# Altium schematic sheet MCU_CORE.SchDoc
size A4; SheetNumber: 4; SheetTotal: 9
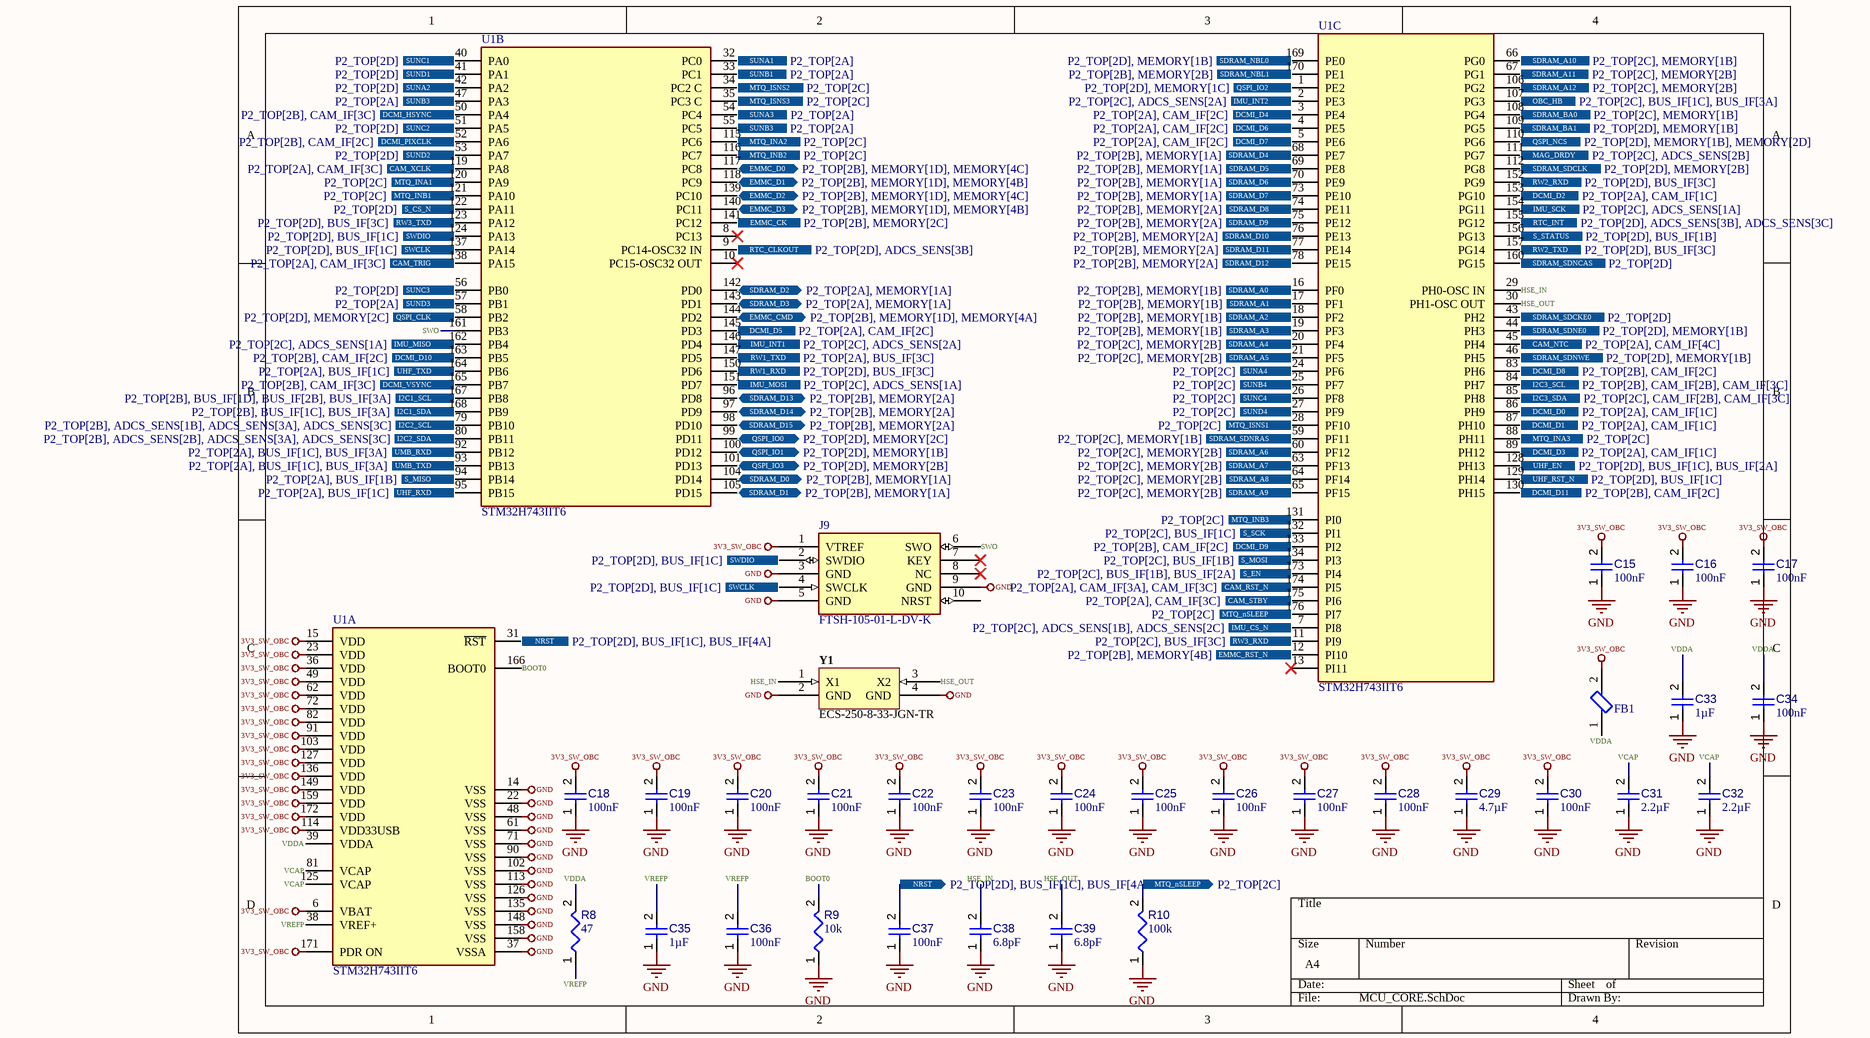
[diagram p0: MCU_CORE.SchDoc]

## Parts
C15  value 100nF  [CAPC0402(1005)60_L]  (hidden comment: Capacitor 100nF +/-20% 25V 0402)
C16  value 100nF  [CAPC0402(1005)60_L]  (hidden comment: Capacitor 100nF +/-20% 25V 0402)
C17  value 100nF  [CAPC0402(1005)60_L]  (hidden comment: Capacitor 100nF +/-20% 25V 0402)
C18  value 100nF  [CAPC0402(1005)60_L]  (hidden comment: Capacitor 100nF +/-20% 25V 0402)
C19  value 100nF  [CAPC0402(1005)60_L]  (hidden comment: Capacitor 100nF +/-20% 25V 0402)
C20  value 100nF  [CAPC0402(1005)60_L]  (hidden comment: Capacitor 100nF +/-20% 25V 0402)
C21  value 100nF  [CAPC0402(1005)60_L]  (hidden comment: Capacitor 100nF +/-20% 25V 0402)
C22  value 100nF  [CAPC0402(1005)60_L]  (hidden comment: Capacitor 100nF +/-20% 25V 0402)
C23  value 100nF  [CAPC0402(1005)60_L]  (hidden comment: Capacitor 100nF +/-20% 25V 0402)
C24  value 100nF  [CAPC0402(1005)60_L]  (hidden comment: Capacitor 100nF +/-20% 25V 0402)
C25  value 100nF  [CAPC0402(1005)60_L]  (hidden comment: Capacitor 100nF +/-20% 25V 0402)
C26  value 100nF  [CAPC0402(1005)60_L]  (hidden comment: Capacitor 100nF +/-20% 25V 0402)
C27  value 100nF  [CAPC0402(1005)60_L]  (hidden comment: Capacitor 100nF +/-20% 25V 0402)
C28  value 100nF  [CAPC0402(1005)60_L]  (hidden comment: Capacitor 100nF +/-20% 25V 0402)
C29  value 4.7µF  [CAPC0805(2012)145_L]  (hidden comment: Capacitor 4.7µF +/-40% 25V 0805)
C30  value 100nF  [CAPC0402(1005)60_L]  (hidden comment: Capacitor 100nF +/-20% 10V 0402)
C31  value 2.2µF  [CAPC0603(1608)100_L]  (hidden comment: Capacitor 4.7µF +/-20% 10V 0603)
C32  value 2.2µF  [CAPC0603(1608)100_L]  (hidden comment: Capacitor 4.7µF +/-20% 10V 0603)
C33  value 1µF  [CAPC0603(1608)100_L]  (hidden comment: Capacitor 1µF +/-0.1% 25V 0603)
C34  value 100nF  [CAPC0402(1005)60_L]  (hidden comment: Capacitor 100nF +/-20% 10V 0402)
C35  value 1µF  [CAPC0603(1608)100_L]  (hidden comment: Capacitor 1µF +/-0.1% 25V 0603)
C36  value 100nF  [CAPC0402(1005)60_L]  (hidden comment: Capacitor 100nF +/-20% 10V 0402)
C37  value 100nF  [CAPC0402(1005)60_L]  (hidden comment: Capacitor 100nF +/-20% 10V 0402)
C38  value 6.8pF  [CAPC1005X56X25NL10T15]  (hidden comment: Capacitor 6.8 nF +/- 10% 16 V 0402)
C39  value 6.8pF  [CAPC1005X56X25NL10T15]  (hidden comment: Capacitor 6.8 nF +/- 10% 16 V 0402)
FB1  BLM15AG601SN1D  [FP-BLM15-0_05-IPC_A]  (value not drawn)
J9  FTSH-105-01-L-DV-K  [SMTC-FTSH-105-01-L-DV-K_V]
R8  value 47  [RESC0402(1005)_L]  (hidden comment: Resistor 47K5 +/-1 % 0402 63 mW)
R9  value 10k  [RESC1005X40X25ML05T05]  (hidden comment: Resistor 10k +/-1% 0402 100 mW)
R10  value 100k  [RESC1005X40X25ML05T05]  (hidden comment: Resistor 100k +/-1% 0402 100 mW)
U1  STM32H743IIT6  [FP-LQFP176-1T-IPC_B]  (parts A,B,C of 3)
Y1  ECS-250-8-33-JGN-TR  [ECS-250-8-33-JGN-TR-Footprint-1]

## Ports
CAM_NTC (out, see P2_TOP[2A], CAM_IF[4C]), CAM_RST_N (out, see P2_TOP[2A], CAM_IF[3A], CAM_IF[3C]), CAM_STBY (out, see P2_TOP[2A], CAM_IF[3C]), CAM_TRIG (out, see P2_TOP[2A], CAM_IF[3C]), CAM_XCLK (out, see P2_TOP[2A], CAM_IF[3C]), DCMI_D0 (out, see P2_TOP[2A], CAM_IF[1C]), DCMI_D1 (out, see P2_TOP[2A], CAM_IF[1C]), DCMI_D2 (out, see P2_TOP[2A], CAM_IF[1C]), DCMI_D3 (out, see P2_TOP[2A], CAM_IF[1C]), DCMI_D4 (out, see P2_TOP[2A], CAM_IF[2C]), DCMI_D5 (out, see P2_TOP[2A], CAM_IF[2C]), DCMI_D6 (out, see P2_TOP[2A], CAM_IF[2C]), DCMI_D7 (out, see P2_TOP[2A], CAM_IF[2C]), DCMI_D8 (out, see P2_TOP[2B], CAM_IF[2C]), DCMI_D9 (out, see P2_TOP[2B], CAM_IF[2C]), DCMI_D10 (out, see P2_TOP[2B], CAM_IF[2C]), DCMI_D11 (out, see P2_TOP[2B], CAM_IF[2C]), DCMI_HSYNC (out, see P2_TOP[2B], CAM_IF[3C]), DCMI_PIXCLK (out, see P2_TOP[2B], CAM_IF[2C]), DCMI_VSYNC (out, see P2_TOP[2B], CAM_IF[3C]), EMMC_CK (out, see P2_TOP[2B], MEMORY[2C]), EMMC_CMD (bidir, see P2_TOP[2B], MEMORY[1D], MEMORY[4A]), EMMC_D0 (bidir, see P2_TOP[2B], MEMORY[1D], MEMORY[4C]), EMMC_D1 (bidir, see P2_TOP[2B], MEMORY[1D], MEMORY[4B]), EMMC_D2 (bidir, see P2_TOP[2B], MEMORY[1D], MEMORY[4C]), EMMC_D3 (bidir, see P2_TOP[2B], MEMORY[1D], MEMORY[4B]), EMMC_RST_N (out, see P2_TOP[2B], MEMORY[4B]), I2C1_SCL (out, see P2_TOP[2B], BUS_IF[1D], BUS_IF[2B], BUS_IF[3A]), I2C1_SDA (out, see P2_TOP[2B], BUS_IF[1C], BUS_IF[3A]), I2C2_SCL (out, see P2_TOP[2B], ADCS_SENS[1B], ADCS_SENS[3A], ADCS_SENS[3C]), I2C2_SDA (out, see P2_TOP[2B], ADCS_SENS[2B], ADCS_SENS[3A], ADCS_SENS[3C]), I2C3_SCL (out, see P2_TOP[2B], CAM_IF[2B], CAM_IF[3C]), I2C3_SDA (out, see P2_TOP[2C], CAM_IF[2B], CAM_IF[3C]), IMU_CS_N (out, see P2_TOP[2C], ADCS_SENS[1B], ADCS_SENS[2C]), IMU_INT1 (out, see P2_TOP[2C], ADCS_SENS[2A]), IMU_INT2 (out, see P2_TOP[2C], ADCS_SENS[2A]), IMU_MISO (out, see P2_TOP[2C], ADCS_SENS[1A]), IMU_MOSI (out, see P2_TOP[2C], ADCS_SENS[1A]), IMU_SCK (out, see P2_TOP[2C], ADCS_SENS[1A]), MAG_DRDY (out, see P2_TOP[2C], ADCS_SENS[2B]), MTQ_INA1 (out, see P2_TOP[2C]), MTQ_INA2 (out, see P2_TOP[2C]), MTQ_INA3 (out, see P2_TOP[2C]), MTQ_INB1 (out, see P2_TOP[2C]), MTQ_INB2 (out, see P2_TOP[2C]), MTQ_INB3 (out, see P2_TOP[2C]), MTQ_ISNS1 (out, see P2_TOP[2C]), MTQ_ISNS2 (out, see P2_TOP[2C]), MTQ_ISNS3 (out, see P2_TOP[2C]), MTQ_nSLEEP (out, see P2_TOP[2C]), NRST (out, see P2_TOP[2D], BUS_IF[1C], BUS_IF[4A]), OBC_HB (out, see P2_TOP[2C], BUS_IF[1C], BUS_IF[3A]), QSPI_CLK (out, see P2_TOP[2D], MEMORY[2C]), QSPI_IO0 (bidir, see P2_TOP[2D], MEMORY[2C]), QSPI_IO1 (bidir, see P2_TOP[2D], MEMORY[1B]), QSPI_IO2 (out, see P2_TOP[2D], MEMORY[1C]), QSPI_IO3 (bidir, see P2_TOP[2D], MEMORY[2B]), QSPI_NCS (out, see P2_TOP[2D], MEMORY[1B], MEMORY[2D]), RTC_CLKOUT (out, see P2_TOP[2D], ADCS_SENS[3B]), RTC_INT (out, see P2_TOP[2D], ADCS_SENS[3B], ADCS_SENS[3C]), RW1_RXD (out, see P2_TOP[2D], BUS_IF[3C]), RW1_TXD (out, see P2_TOP[2A], BUS_IF[3C]), RW2_RXD (out, see P2_TOP[2D], BUS_IF[3C]), RW2_TXD (out, see P2_TOP[2D], BUS_IF[3C]), RW3_RXD (out, see P2_TOP[2C], BUS_IF[3C]), RW3_TXD (out, see P2_TOP[2D], BUS_IF[3C]), S_CS_N (out, see P2_TOP[2D]), S_EN (out, see P2_TOP[2C], BUS_IF[1B], BUS_IF[2A]), S_MISO (out, see P2_TOP[2A], BUS_IF[1B]), S_MOSI (out, see P2_TOP[2C], BUS_IF[1B]), S_SCK (out, see P2_TOP[2C], BUS_IF[1C]), S_STATUS (out, see P2_TOP[2D], BUS_IF[1B]), SDRAM_A0 (out, see P2_TOP[2B], MEMORY[1B]), SDRAM_A1 (out, see P2_TOP[2B], MEMORY[1B]), SDRAM_A2 (out, see P2_TOP[2B], MEMORY[1B]), SDRAM_A3 (out, see P2_TOP[2B], MEMORY[1B]), SDRAM_A4 (out, see P2_TOP[2C], MEMORY[2B]), SDRAM_A5 (out, see P2_TOP[2C], MEMORY[2B]), SDRAM_A6 (out, see P2_TOP[2C], MEMORY[2B]), SDRAM_A7 (out, see P2_TOP[2C], MEMORY[2B]), SDRAM_A8 (out, see P2_TOP[2C], MEMORY[2B]), SDRAM_A9 (out, see P2_TOP[2C], MEMORY[2B]), SDRAM_A10 (out, see P2_TOP[2C], MEMORY[1B]), SDRAM_A11 (out, see P2_TOP[2C], MEMORY[2B]), SDRAM_A12 (out, see P2_TOP[2C], MEMORY[2B]), SDRAM_BA0 (out, see P2_TOP[2C], MEMORY[1B]), SDRAM_BA1 (out, see P2_TOP[2D], MEMORY[1B]), SDRAM_D0 (bidir, see P2_TOP[2B], MEMORY[1A]), SDRAM_D1 (bidir, see P2_TOP[2B], MEMORY[1A]), SDRAM_D2 (bidir, see P2_TOP[2A], MEMORY[1A]), SDRAM_D3 (bidir, see P2_TOP[2A], MEMORY[1A]), SDRAM_D4 (out, see P2_TOP[2B], MEMORY[1A]), SDRAM_D5 (out, see P2_TOP[2B], MEMORY[1A]), SDRAM_D6 (out, see P2_TOP[2B], MEMORY[1A]), SDRAM_D7 (out, see P2_TOP[2B], MEMORY[1A]), SDRAM_D8 (out, see P2_TOP[2B], MEMORY[2A]), SDRAM_D9 (out, see P2_TOP[2B], MEMORY[2A]), SDRAM_D10 (out, see P2_TOP[2B], MEMORY[2A]), SDRAM_D11 (out, see P2_TOP[2B], MEMORY[2A]), SDRAM_D12 (out, see P2_TOP[2B], MEMORY[2A]), SDRAM_D13 (bidir, see P2_TOP[2B], MEMORY[2A]), SDRAM_D14 (bidir, see P2_TOP[2B], MEMORY[2A]), SDRAM_D15 (bidir, see P2_TOP[2B], MEMORY[2A]), SDRAM_NBL0 (out, see P2_TOP[2D], MEMORY[1B]), SDRAM_NBL1 (out, see P2_TOP[2B], MEMORY[2B]), SDRAM_SDCKE0 (out, see P2_TOP[2D]), SDRAM_SDCLK (out, see P2_TOP[2D], MEMORY[2B]), SDRAM_SDNCAS (out, see P2_TOP[2D]), SDRAM_SDNE0 (out, see P2_TOP[2D], MEMORY[1B]), SDRAM_SDNRAS (out, see P2_TOP[2C], MEMORY[1B]), SDRAM_SDNWE (out, see P2_TOP[2D], MEMORY[1B]), SUNA1 (out, see P2_TOP[2A]), SUNA2 (out, see P2_TOP[2D]), SUNA3 (out, see P2_TOP[2A]), SUNA4 (out, see P2_TOP[2C]), SUNB1 (out, see P2_TOP[2A]), SUNB3 (out, see P2_TOP[2A]), SUNB4 (out, see P2_TOP[2C]), SUNC1 (out, see P2_TOP[2D]), SUNC2 (out, see P2_TOP[2D]), SUNC3 (out, see P2_TOP[2D]), SUNC4 (out, see P2_TOP[2C]), SUND1 (out, see P2_TOP[2D]), SUND2 (out, see P2_TOP[2D]), SUND3 (out, see P2_TOP[2A]), SUND4 (out, see P2_TOP[2C]), SWCLK (out, see P2_TOP[2D], BUS_IF[1C]), SWDIO (out, see P2_TOP[2D], BUS_IF[1C]), UHF_EN (out, see P2_TOP[2D], BUS_IF[1C], BUS_IF[2A]), UHF_RST_N (out, see P2_TOP[2D], BUS_IF[1C]), UHF_RXD (out, see P2_TOP[2A], BUS_IF[1C]), UHF_TXD (out, see P2_TOP[2A], BUS_IF[1C]), UMB_RXD (out, see P2_TOP[2A], BUS_IF[1C], BUS_IF[3A]), UMB_TXD (out, see P2_TOP[2A], BUS_IF[1C], BUS_IF[3A])

## Nets
3V3_SW_OBC: C15.2 C16.2 C17.2 C18.2 C19.2 C20.2 C21.2 C22.2 C23.2 C24.2 C25.2 C26.2 C27.2 C28.2 C29.2 C30.2 FB1.2 J9.1(VTREF) U1.6(VBAT) U1.15(VDD) U1.23(VDD) U1.36(VDD) U1.49(VDD) U1.62(VDD) U1.72(VDD) U1.82(VDD) U1.91(VDD) U1.103(VDD) U1.114(VDD33USB) U1.127(VDD) U1.136(VDD) U1.149(VDD) U1.159(VDD) U1.171(PDR_ON) U1.172(VDD)
GND: C15.1 C16.1 C17.1 C18.1 C19.1 C20.1 C21.1 C22.1 C23.1 C24.1 C25.1 C26.1 C27.1 C28.1 C29.1 C30.1 C31.1 C32.1 C33.1 C34.1 C35.1 C36.1 C37.1 C38.1 C39.1 J9.3(GND) J9.5(GND) J9.9(GND) R9.1 R10.1 U1.14(VSS) U1.22(VSS) U1.37(VSSA) U1.48(VSS) U1.61(VSS) U1.71(VSS) U1.90(VSS) U1.102(VSS) U1.113(VSS) U1.126(VSS) U1.135(VSS) U1.148(VSS) U1.158(VSS) Y1.2(GND) Y1.4(GND)
BOOT0: R9.2 U1.166(BOOT0)
CAM_NTC: U1.45(PH4) ; port CAM_NTC
CAM_RST_N: U1.174(PI5) ; port CAM_RST_N
CAM_STBY: U1.175(PI6) ; port CAM_STBY
CAM_TRIG: U1.138(PA15) ; port CAM_TRIG
CAM_XCLK: U1.119(PA8) ; port CAM_XCLK
DCMI_D0: U1.86(PH9) ; port DCMI_D0
DCMI_D1: U1.87(PH10) ; port DCMI_D1
DCMI_D2: U1.153(PG10) ; port DCMI_D2
DCMI_D3: U1.89(PH12) ; port DCMI_D3
DCMI_D4: U1.3(PE4) ; port DCMI_D4
DCMI_D5: U1.145(PD3) ; port DCMI_D5
DCMI_D6: U1.4(PE5) ; port DCMI_D6
DCMI_D7: U1.5(PE6) ; port DCMI_D7
DCMI_D8: U1.83(PH6) ; port DCMI_D8
DCMI_D9: U1.133(PI2) ; port DCMI_D9
DCMI_D10: U1.163(PB5) ; port DCMI_D10
DCMI_D11: U1.130(PH15) ; port DCMI_D11
DCMI_HSYNC: U1.50(PA4) ; port DCMI_HSYNC
DCMI_PIXCLK: U1.52(PA6) ; port DCMI_PIXCLK
DCMI_VSYNC: U1.165(PB7) ; port DCMI_VSYNC
EMMC_CK: U1.141(PC12) ; port EMMC_CK
EMMC_CMD: U1.144(PD2) ; port EMMC_CMD
EMMC_D0: U1.117(PC8) ; port EMMC_D0
EMMC_D1: U1.118(PC9) ; port EMMC_D1
EMMC_D2: U1.139(PC10) ; port EMMC_D2
EMMC_D3: U1.140(PC11) ; port EMMC_D3
EMMC_RST_N: U1.12(PI10) ; port EMMC_RST_N
HSE_IN: C38.2 U1.29(PH0-OSC_IN) Y1.1(X1)
HSE_OUT: C39.2 U1.30(PH1-OSC_OUT) Y1.3(X2)
I2C1_SCL: U1.167(PB8) ; port I2C1_SCL
I2C1_SDA: U1.168(PB9) ; port I2C1_SDA
I2C2_SCL: U1.79(PB10) ; port I2C2_SCL
I2C2_SDA: U1.80(PB11) ; port I2C2_SDA
I2C3_SCL: U1.84(PH7) ; port I2C3_SCL
I2C3_SDA: U1.85(PH8) ; port I2C3_SDA
IMU_CS_N: U1.7(PI8) ; port IMU_CS_N
IMU_INT1: U1.146(PD4) ; port IMU_INT1
IMU_INT2: U1.2(PE3) ; port IMU_INT2
IMU_MISO: U1.162(PB4) ; port IMU_MISO
IMU_MOSI: U1.151(PD7) ; port IMU_MOSI
IMU_SCK: U1.154(PG11) ; port IMU_SCK
MAG_DRDY: U1.111(PG7) ; port MAG_DRDY
MTQ_INA1: U1.120(PA9) ; port MTQ_INA1
MTQ_INA2: U1.115(PC6) ; port MTQ_INA2
MTQ_INA3: U1.88(PH11) ; port MTQ_INA3
MTQ_INB1: U1.121(PA10) ; port MTQ_INB1
MTQ_INB2: U1.116(PC7) ; port MTQ_INB2
MTQ_INB3: U1.131(PI0) ; port MTQ_INB3
MTQ_ISNS1: U1.28(PF10) ; port MTQ_ISNS1
MTQ_ISNS2: U1.34(PC2_C) ; port MTQ_ISNS2
MTQ_ISNS3: U1.35(PC3_C) ; port MTQ_ISNS3
MTQ_nSLEEP: R10.2 U1.176(PI7) ; port MTQ_nSLEEP
NRST: C37.2 U1.31(~{RST}) ; port NRST
OBC_HB: U1.107(PG3) ; port OBC_HB
QSPI_CLK: U1.58(PB2) ; port QSPI_CLK
QSPI_IO0: U1.99(PD11) ; port QSPI_IO0
QSPI_IO1: U1.100(PD12) ; port QSPI_IO1
QSPI_IO2: U1.1(PE2) ; port QSPI_IO2
QSPI_IO3: U1.101(PD13) ; port QSPI_IO3
QSPI_NCS: U1.110(PG6) ; port QSPI_NCS
RTC_CLKOUT: U1.9(PC14-OSC32_IN) ; port RTC_CLKOUT
RTC_INT: U1.155(PG12) ; port RTC_INT
RW1_RXD: U1.150(PD6) ; port RW1_RXD
RW1_TXD: U1.147(PD5) ; port RW1_TXD
RW2_RXD: U1.152(PG9) ; port RW2_RXD
RW2_TXD: U1.157(PG14) ; port RW2_TXD
RW3_RXD: U1.11(PI9) ; port RW3_RXD
RW3_TXD: U1.123(PA12) ; port RW3_TXD
S_CS_N: U1.122(PA11) ; port S_CS_N
S_EN: U1.173(PI4) ; port S_EN
S_MISO: U1.94(PB14) ; port S_MISO
S_MOSI: U1.134(PI3) ; port S_MOSI
S_SCK: U1.132(PI1) ; port S_SCK
S_STATUS: U1.156(PG13) ; port S_STATUS
SDRAM_A0: U1.16(PF0) ; port SDRAM_A0
SDRAM_A1: U1.17(PF1) ; port SDRAM_A1
SDRAM_A2: U1.18(PF2) ; port SDRAM_A2
SDRAM_A3: U1.19(PF3) ; port SDRAM_A3
SDRAM_A4: U1.20(PF4) ; port SDRAM_A4
SDRAM_A5: U1.21(PF5) ; port SDRAM_A5
SDRAM_A6: U1.60(PF12) ; port SDRAM_A6
SDRAM_A7: U1.63(PF13) ; port SDRAM_A7
SDRAM_A8: U1.64(PF14) ; port SDRAM_A8
SDRAM_A9: U1.65(PF15) ; port SDRAM_A9
SDRAM_A10: U1.66(PG0) ; port SDRAM_A10
SDRAM_A11: U1.67(PG1) ; port SDRAM_A11
SDRAM_A12: U1.106(PG2) ; port SDRAM_A12
SDRAM_BA0: U1.108(PG4) ; port SDRAM_BA0
SDRAM_BA1: U1.109(PG5) ; port SDRAM_BA1
SDRAM_D0: U1.104(PD14) ; port SDRAM_D0
SDRAM_D1: U1.105(PD15) ; port SDRAM_D1
SDRAM_D2: U1.142(PD0) ; port SDRAM_D2
SDRAM_D3: U1.143(PD1) ; port SDRAM_D3
SDRAM_D4: U1.68(PE7) ; port SDRAM_D4
SDRAM_D5: U1.69(PE8) ; port SDRAM_D5
SDRAM_D6: U1.70(PE9) ; port SDRAM_D6
SDRAM_D7: U1.73(PE10) ; port SDRAM_D7
SDRAM_D8: U1.74(PE11) ; port SDRAM_D8
SDRAM_D9: U1.75(PE12) ; port SDRAM_D9
SDRAM_D10: U1.76(PE13) ; port SDRAM_D10
SDRAM_D11: U1.77(PE14) ; port SDRAM_D11
SDRAM_D12: U1.78(PE15) ; port SDRAM_D12
SDRAM_D13: U1.96(PD8) ; port SDRAM_D13
SDRAM_D14: U1.97(PD9) ; port SDRAM_D14
SDRAM_D15: U1.98(PD10) ; port SDRAM_D15
SDRAM_NBL0: U1.169(PE0) ; port SDRAM_NBL0
SDRAM_NBL1: U1.170(PE1) ; port SDRAM_NBL1
SDRAM_SDCKE0: U1.43(PH2) ; port SDRAM_SDCKE0
SDRAM_SDCLK: U1.112(PG8) ; port SDRAM_SDCLK
SDRAM_SDNCAS: U1.160(PG15) ; port SDRAM_SDNCAS
SDRAM_SDNE0: U1.44(PH3) ; port SDRAM_SDNE0
SDRAM_SDNRAS: U1.59(PF11) ; port SDRAM_SDNRAS
SDRAM_SDNWE: U1.46(PH5) ; port SDRAM_SDNWE
SUNA1: U1.32(PC0) ; port SUNA1
SUNA2: U1.42(PA2) ; port SUNA2
SUNA3: U1.54(PC4) ; port SUNA3
SUNA4: U1.24(PF6) ; port SUNA4
SUNB1: U1.33(PC1) ; port SUNB1
SUNB3: U1.47(PA3) U1.55(PC5) ; port SUNB3
SUNB4: U1.25(PF7) ; port SUNB4
SUNC1: U1.40(PA0) ; port SUNC1
SUNC2: U1.51(PA5) ; port SUNC2
SUNC3: U1.56(PB0) ; port SUNC3
SUNC4: U1.26(PF8) ; port SUNC4
SUND1: U1.41(PA1) ; port SUND1
SUND2: U1.53(PA7) ; port SUND2
SUND3: U1.57(PB1) ; port SUND3
SUND4: U1.27(PF9) ; port SUND4
SWCLK: J9.4(SWCLK) U1.137(PA14) ; port SWCLK
SWDIO: J9.2(SWDIO) U1.124(PA13) ; port SWDIO
SWO: J9.6(SWO) U1.161(PB3)
UHF_EN: U1.128(PH13) ; port UHF_EN
UHF_RST_N: U1.129(PH14) ; port UHF_RST_N
UHF_RXD: U1.95(PB15) ; port UHF_RXD
UHF_TXD: U1.164(PB6) ; port UHF_TXD
UMB_RXD: U1.92(PB12) ; port UMB_RXD
UMB_TXD: U1.93(PB13) ; port UMB_TXD
VCAP: C31.2 C32.2 U1.81(VCAP) U1.125(VCAP)
VDDA: C33.2 C34.2 FB1.1 R8.2 U1.39(VDDA)
VREFP: C35.2 C36.2 R8.1 U1.38(VREF+)

Not connected (* = marked no-connect by the designer): J9 7(KEY)* 8(NC)* 10(NRST); U1 8(PC13)* 10(PC15-OSC32_OUT)* 13(PI11)*

## Library data of the parts
C15-C28 = CMP-001-00065-4: Chip Capacitor, 100nF +/-20%, 25V, 0402, Thickness 0.6 mm; Tolerance: 10%; Max Operating Temperature: 85°C; Min Operating Temperature: -55°C; Pins: 2; Voltage Rating: 25V; Mounting Technology: SMT; Case/Package: 0402
C29 = CMP-001-00080-4: Chip Capacitor, 4.7µF +/-40%, 25V, 0805, Thickness 1.45 mm; Tolerance: 20%; Voltage Rating: 25V; Min Operating Temperature: -55°C; Max Operating Temperature: 85°C; Pins: 2; Mounting Technology: SMT; Case/Package: 0805
C30 C34 C36 C37 = CMP-001-00061-3: Chip Capacitor, 100nF +/-20%, 10V, 0402, Thickness 0.6 mm; Tolerance: 20%; Mounting Technology: SMT; Voltage Rating: 10V; Max Operating Temperature: 85°C; Pins: 2; Case/Package: 0402; Min Operating Temperature: -55°C
C31 C32 = CMP-001-00076-4: Chip Capacitor, 4.7µF +/-20%, 10V, 0603, Thickness 1 mm; Tolerance: 10%; Mounting Technology: SMT; Case/Package: 0603; Pins: 2; Min Operating Temperature: -55°C; Max Operating Temperature: 85°C; Voltage Rating: 10V
C33 C35 = CMP-001-00055-4: Chip Capacitor, 1µF +/-0.1%, 25V, 0603, Thickness 1 mm; Tolerance: 20%; Min Operating Temperature: -55°C; Max Operating Temperature: 85°C; Voltage Rating: 25V; Mounting Technology: SMT; Case/Package: 0603; Pins: 2
C38 C39 = CMP-001-00000-6: Chip Capacitor, 6.8 nF, +/- 10%, 16 V, 0402 (1005 Metric); Capacitor Type: Ceramic; Voltage Rating: 16V; RoHS Compliant: True; Pins: 2; Case/Package: 0402; Min Operating Temperature: -55°C; Tolerance: 10%; Mounting Technology: SM; Max Operating Temperature: 125°C
FB1 = CMP-00030-00001-1: Ferrite Beads Multi-Layer 600Ohm 25% 100MHz 300mA 520mOhm DCR 0402 Paper T/R; Material: Ferrite, Steel; Number of Circuits: 1; DC Resistance (DCR): 520mΩ; Impedance: 600Ω; Shielding: Unshielded; Country of Origin: Japan; Lead Free: Lead Free; Introduction Date: 2002-09-05; Test Frequency: 100MHz; Radiation Hardening: No; REACH SVHC: Unaffected; Lifecycle Status: Production; RMS Current (Irms): 300mA; Depth: 550µm; Number of Terminals: 2; Height: 500µm; Max DC Current: 300mA; Min Operating Temperature: -55°C; Core Material: Ferrite; Packaging: Tape and Reel; RoHS: Compliant; Length: 1mm; Case Code (Imperial): 0402; Frequency: 100MHz; ESR: 520mΩ; Clock Frequency: 100MHz; Number of Lines: 1; DC Current: 300mA; Case/Package: 0402; Max Current Rating: 300mA; Max Operating Temperature: 125°C; Schedule B: 8504500000, 8504500000; Current Rating: 300mA; Termination: SMD/SMT; Military Standard: Not; Tolerance: 25%; Export Control Classification Number (ECCN) Code: EAR99; Harmonized Tariff Schedule (HTS) Code: 8504.50.80.00; Case Code (Metric): 1005; Mounting Technology: Surface Mount; Pins: 2; Width: 500µm
J9 = CMP-002-00079-2: Conn Shrouded Header (2 Sides) HDR 10 POS 1.27mm Solder ST Top Entry SMD TIGER CLAW™ Tube; Manufacturer Lifecycle Status: PRODUCTION; Max Current Rating: 1.75A; Number of Contacts: 10; Connector Type: Male Pin; Gender: Female; Housing Color: Black; Color: Black; REACH SVHC: Unaffected; Termination: Solder; Pitch: 1.27mm; Row Spacing: 1.27mm; Contact Plating: Gold; Radiation Hardening: No; Length: 6.35mm; Depth: 3.43mm; Contact Mating Length: 3.048mm; Lifecycle Status: Production; Pins: 10; Mounting Technology: Surface Mount; Lead Free: Lead Free; Contact Material: Bronze; Number of Rows: 2; Min Operating Temperature: -55°C; Number of Positions: 10; Max Operating Temperature: 125°C; Housing Material: Polymer; RoHS: Compliant
R8 = CMP-009-00137-3: Chip Resistor, 47,5 kOhms, +/-1 %, 63 mW, -55 to 155 degC, 0402; Power: 63mW; Tolerance: 1%; Pins: 2; Case/Package: 0402; Min Operating Temperature: -55°C; Max Operating Temperature: 155°C
R9 = CMP-009-00015-5: Chip Resistor, 10 KOhm, +/- 1%, 0.1 W, -55 to 155 degC, 0402 (1005 Metric); Voltage Rating: 50V; Power: 100mW; Case/Package: 0402; RoHS Compliant: True; Min Operating Temperature: -55°C; Mounting Technology: SM; Tolerance: 1%; Max Operating Temperature: 155°C; Pins: 2
R10 = CMP-009-00022-5: Chip Resistor, 100 KOhm, +/- 1%, 0.1 W, -55 to 155 degC, 0402 (1005 Metric); Power: 100mW; Voltage Rating: 50V; Mounting Technology: SM; Pins: 2; Min Operating Temperature: -55°C; Tolerance: 1%; RoHS Compliant: True; Case/Package: 0402; Max Operating Temperature: 155°C
U1 = CMP-020-00026-1: MCU 32-Bit STM32 ARM Cortex M7 RISC 2MB Flash 1.8V/2.5V/3.3V 176-Pin LQFP Tray; Max Supply Current: 100mA; Clock Frequency: 480MHz; Number of I/Os: 11; Number of I2C Channels: 4; Number of USB Channels: 2; Number of A/D Converters: 3; RAM Size: 1MB; Frequency: 400MHz; Number of ADC Channels: 36; Peripherals: POR, RTC; Nominal Supply Voltage (DC): 3.3V; Number of Channels: 32; Max Supply Voltage: 3.6V; Number of Timers/Counters: 21; Nominal Supply Current: 4µA; ADC Channels (Resolution): 32-Ch 16-Bit; Min Supply Voltage: 1.62V; Data Bus Width: 32b; Interface: CAN, Ethernet, I2C, IrDA, LIN, SMBus, SPI, UART, USART, USB; Number of SPI Channels: 6; Number of Ethernet Channels: 1; DAC Channels (Resolution): 2-Ch 12-Bit; Max Junction Temperature (Tj): 125°C; Length: 24mm; Terminal Pitch: 500µm; Number of Terminals: 176; Introduction Date: 2016-10-19; Country of Origin: Mainland China; Export Control Classification Number (ECCN) Code: 3A991.A.2; China RoHS: Compliant; Lifecycle Status: Production; Min Operating Temperature: -40°C; Width: 24mm; Max Operating Temperature: 85°C; Number of PWM Channels: 2; Flash Memory Size: 2MB; REACH SVHC: Unaffected; Number of USART Channels: 4; Memory Format: FLASH; Memory Size: 2MB; Height: 1.6mm; Case/Package: LFQFP; Height - Seated (Max): 1.6mm; Temperature Grade: Industrial; Harmonized Tariff Schedule (HTS) Code: 8542.31.00.25; Number of D/A Converters: 2; Ambient Temperature Range High: 85°C; Number of UART Channels: 4; Schedule B: 8542310000; RoHS: Compliant
Y1 = CMP-003-00030-2: Crystal 25MHz ±20ppm (Tol) ±30ppm (Stability) 8pF FUND 40Ohm 4-Pin Mini-CSMD T/R; Frequency Tolerance: 0.002%; ESR: 40; Lifecycle Status: Production; Frequency: 25MHz; Export Control Classification Number (ECCN) Code: EAR99; Mounting Technology: Surface Mount; Max Operating Temperature: 85°C; Introduction Date: 2017-12-19; Load Capacitance: 8pF; Width: 2.5mm; Frequency Stability: 30ppm; RoHS: Compliant; Country of Origin: South Korea, Taiwan; Height - Seated (Max): 800µm; Min Operating Temperature: -40°C; Schedule B: 8541600060, 8541600060; REACH SVHC: Unaffected; Length: 3.2mm